# Altium schematic sheet Power.SchDoc
size A3
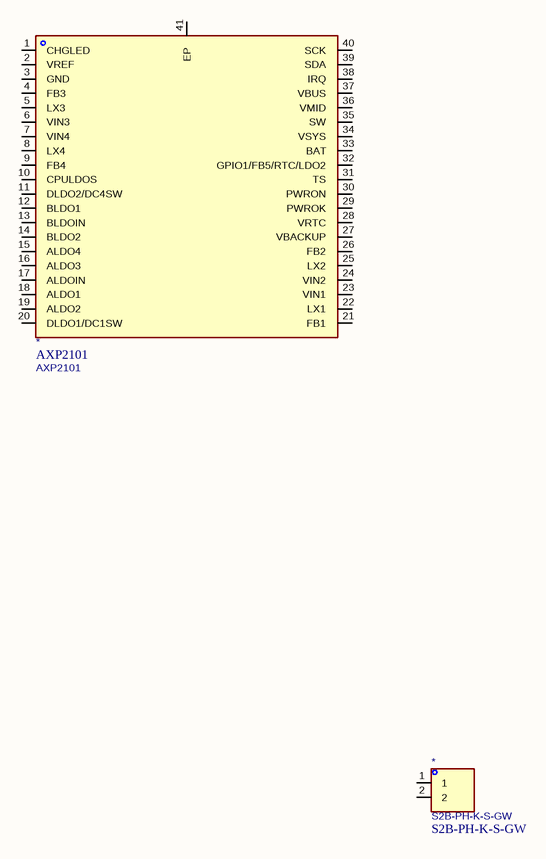
[diagram p0: Power.SchDoc]

## Parts
(Parts that share a designator on the sheet are numbered #1, #2 ... from top to bottom, then left to right.)
*#1  AXP2101  [QFN-40_L5.0-W5.0-P0.40-TL-EP3.4]
*#2  S2B-PH-K-S-GW  [CONN-TH_S2B-PH-K-S-GW]

## Nets

Not connected (* = marked no-connect by the designer): *#1 1(CHGLED) 2(VREF) 3(GND) 4(FB3) 5(LX3) 6(VIN3) 7(VIN4) 8(LX4) 9(FB4) 10(CPULDOS) 11(DLDO2/DC4SW) 12(BLDO1) 13(BLDOIN) 14(BLDO2) 15(ALDO4) 16(ALDO3) 17(ALDOIN) 18(ALDO1) 19(ALDO2) 20(DLDO1/DC1SW) 21(FB1) 22(LX1) 23(VIN1) 24(VIN2) 25(LX2) 26(FB2) 27(VBACKUP) 28(VRTC) 29(PWROK) 30(PWRON) 31(TS) 32(GPIO1/FB5/RTC/LDO2) 33(BAT) 34(VSYS) 35(SW) 36(VMID) 37(VBUS) 38(IRQ) 39(SDA) 40(SCK) 41(EP); *#2 1 2

## Library data of the parts
*#1 = AXP2101: Manufacturer: x-powers(芯智汇); ki_keywords: Microcontroller Units (MCUs/MPUs/SOCs); Footprint: easyeda2kicad:QFN-40_L5.0-W5.0-P0.40-TL-EP3.4; Supplier: https://www.lcsc.com/datasheet/C3036461.pdf; MPN: AXP2101; LCSC Part: C3036461; Value: AXP2101
*#2 = S2B-PH-K-S-GW: Manufacturer: JST; ki_keywords: Wire To Board / Wire To Wire Connector; Footprint: easyeda2kicad:CONN-TH_S2B-PH-K-S-GW; Supplier: https://lcsc.com/product-detail/PH-Connectors_JST_S2B-PH-K-S-GW_PHsocket-1-2P-Curved-needle-pitch2mm_C157932.html; MPN: S2B-PH-K-S-GW; LCSC Part: C157932; Value: S2B-PH-K-S-GW